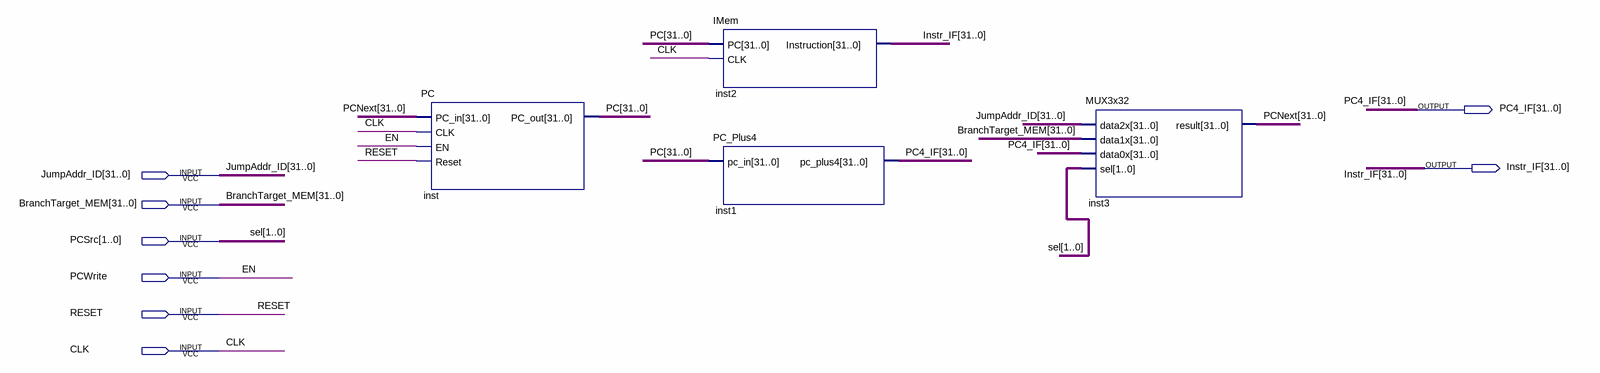
[diagram p0: schematic sheet]
// Quartus schematic IF_Stage.bdf as structural Verilog: 4 symbols, 8 pins
module IF_Stage (
  input  [31:0] JumpAddr_ID,
  input  [31:0] BranchTarget_MEM,
  input  [1:0] PCSrc,
  input  PCWrite,
  input  RESET,
  input  CLK,
  output [31:0] PC4_IF,
  output [31:0] Instr_IF
);

  wire [31:0] PC, PCNext;

  PC inst (.PC_in(PCNext), .CLK(CLK), .EN(PCWrite), .Reset(RESET), .PC_out(PC));
  IMem inst2 (.PC(PC), .CLK(CLK), .Instruction(Instr_IF));
  PC_Plus4 inst1 (.pc_in(PC), .pc_plus4(PC4_IF));
  MUX3x32 inst3 (.data2x(JumpAddr_ID), .data1x(BranchTarget_MEM), .data0x(PC4_IF), .sel(PCSrc), .result(PCNext));

  // Other names for the same wires on the sheet: EN = PCWrite; sel[1:0] = PCSrc
endmodule
